# Altium schematic sheet TempMonitorSchematic.SchDoc
size A4; SheetNumber: 1; SheetTotal: 1
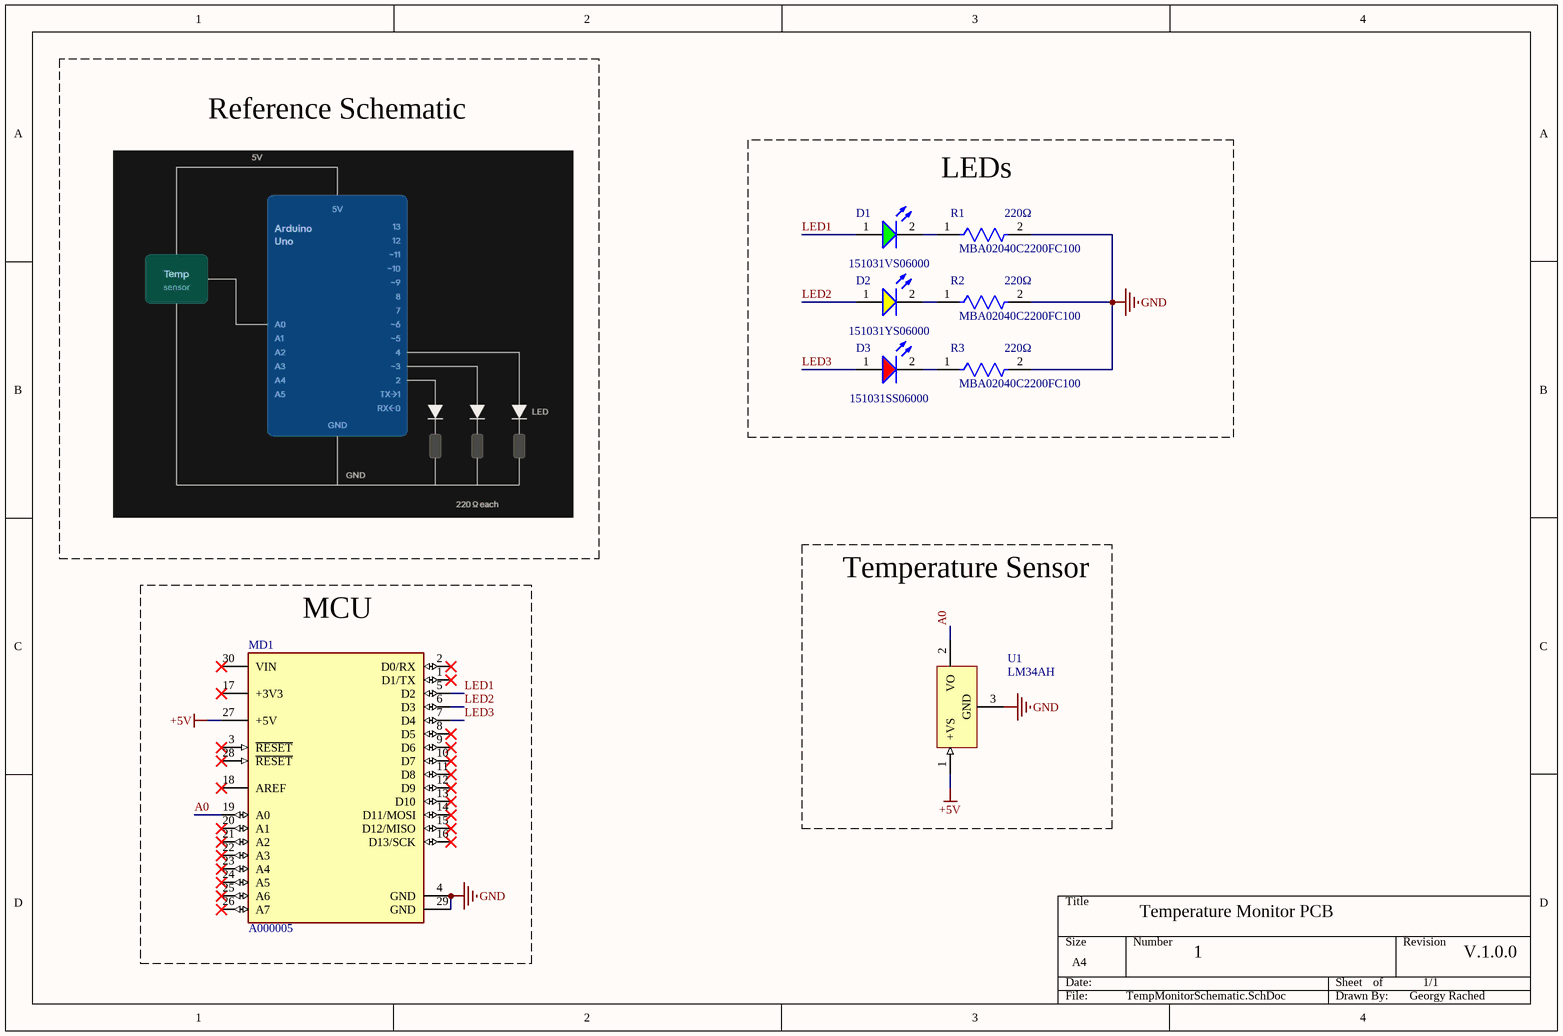
[diagram p0: TempMonitorSchematic.SchDoc]

## Parts
D1  151031VS06000  [WL-TMRC_D3.95H5.3]
D2  151031YS06000  [WL-TMRC_D3.95H5.3]
D3  151031SS06000  [WL-TMRC_D3.95H5.3]
MD1  A000005  [FP-A000005-MFG]
R1  MBA02040C2200FC100  value 220Ω  [FP-MBA0204-MFG]
R2  MBA02040C2200FC100  value 220Ω  [FP-MBA0204-MFG]
R3  MBA02040C2200FC100  value 220Ω  [FP-MBA0204-MFG]
U1  LM34AH  [NDV0003A]

## Blocks framed on the sheet
LEDs: D1-D3 R1-R3
Temperature Sensor: U1
MCU: MD1

## Nets
+5V: MD1.27(+5V) U1.1(+VS)
GND: MD1.4(GND) MD1.29(GND) R1.2 R2.2 R3.2 U1.3(GND)
A0: MD1.19(A0) U1.2(VO)
LED1: D1.1(A) MD1.5(D2)
LED2: D2.1(A) MD1.6(D3)
LED3: D3.1(A) MD1.7(D4)
NetD1_2: D1.2(K) R1.1
NetD2_2: D2.2(K) R2.1
NetD3_2: D3.2(K) R3.1

Not connected (* = marked no-connect by the designer): MD1 1(D1/TX)* 2(D0/RX)* 3(~{RESET})* 8(D5)* 9(D6)* 10(D7)* 11(D8)* 12(D9)* 13(D10)* 14(D11/MOSI)* 15(D12/MISO)* 16(D13/SCK)* 17(+3V3)* 18(AREF)* 20(A1)* 21(A2)* 22(A3)* 23(A4)* 24(A5)* 25(A6)* 26(A7)* 28(~{RESET})* 30(VIN)*

## Notes on the sheet
- Reference Schematic
- Temperature Monitor PCB
- 1
- 1/1
- V.1.0.0
- Georgy Rached

## Library data of the parts
D1 = CMP-1488-00004-3: Led, Green, T-1 (3Mm), 568 Nm, 2.2 V, 30 Ma, 20 Mcd Rohs Compliant: Yes; Manufacturer Lifecycle Status: ACTIVE; Test Current: 20mA; Wavelength: 568nm; Forward Voltage: 2.2V; Viewing Angle: 60°; Lens Style: Circular, Diffused, Round; Max Reverse Voltage (DC): 5V; YEOL: 1 = Estimated lifetime > 10 years; Forward Current: 100mA; Peak Wavelength: 560nm; Luminous Intensity: 30mcd; Case/Package: Radial; Color: Green; Lifecycle Status: Production; Height: 5.3mm; Min Operating Temperature: -40°C; Length: 3mm; RoHS: Compliant; Max Operating Temperature: 85°C; Dominant Wavelength: 568nm; Mount: Through Hole; Lead Free: Lead Free; Lens Size: 3mm; Width: 3mm; Packaging: Bulk; REACH SVHC: Unknown
D2 = CMP-1488-00006-3: Wurth Elektronik LED, WL-TMRC, 3mm (T-1), 590 nm, 3 (Dia.) x 5.3mm; Manufacturer Lifecycle Status: ACTIVE; Forward Voltage: 2V; Test Current: 20mA; Max Reverse Voltage (DC): 5V; Peak Wavelength: 592nm; Luminous Intensity: 110mcd; Viewing Angle: 60°; Forward Current: 100mA; YEOL: 1 = Estimated lifetime > 10 years; Wavelength: 590nm; Color: Yellow; Lens Style: Circular, Diffused, Round; Packaging: Bulk; Case/Package: Radial; Width: 3mm; RoHS: Compliant; Lens Size: 3mm; Max Operating Temperature: 85°C; Lifecycle Status: Production; Min Operating Temperature: -40°C; Height: 5.3mm; Length: 3mm; Dominant Wavelength: 590nm; Mount: Through Hole; REACH SVHC: Unknown
D3 = CMP-1488-00002-3: Wurth Elektronik LED, WL-TMRC, 3mm (T-1), 640 nm, 3 (Dia.) x 5.3 Lmm; Manufacturer Lifecycle Status: ACTIVE; Wavelength: 630nm; Test Current: 20mA; Luminous Intensity: 35mcd; Max Reverse Voltage (DC): 5V; Forward Current: 100mA; Viewing Angle: 60°; Color: Red; Lens Style: Circular, Diffused, Round; Dominant Wavelength: 640nm; Peak Wavelength: 650nm; YEOL: 1 = Estimated lifetime > 10 years; Forward Voltage: 2.2V; Length: 3mm; Width: 3mm; Min Operating Temperature: -40°C; Lifecycle Status: Production; RoHS: Compliant; Height: 5.3mm; Mount: Through Hole; Lens Size: 3mm; REACH SVHC: Unknown; Packaging: Bulk; Case/Package: Radial; Max Operating Temperature: 85°C
MD1 = CMP-189986-000002-1: ARDUINO NANO ATMEGA328 EVAL BRD; Number of Bits: 8; Evaluation Kit: Yes; Operating Supply Voltage: 12V; Interface: I2C; Data Bus Width: 8b; Core Architecture: AVR; Packaging: Bulk; Length: 7inch; Package Quantity: 50; Width: 5inch; REACH SVHC: No SVHC; Weight: 0.358383oz; Series: AVR® ATmega; Height: 0.25inch
R1-R3 = CMP-02408-000005-1: RES 220 OHM 0.4W 1% AXIAL; Manufacturer: Vishay BC Components; Automotive Grade: Grade 1; Voltage Rating: 200V; Temperature Coefficient: 50ppm/°C; Power Rating: 0.25W; Digikey Description: RES 220 OHM 0.4W 1% AXIAL; Height: 1.6mm; Automotive: Yes; Lead Free: Yes; Mouser Description: Thin Film Resistors - Through Hole .4watt 220ohms 1% 1/8watt body size; Temperature Range Low: -55°C; ComponentLink2Description: Datasheet; Temperature: -55°C to +125°C; Device Class L3: Through-Hole Resistors; Manufacturer Part Number: MBA02040C2200FC100; Ipc Land Pattern Name: RESAD500W65L360D160; Octopart: https://octopart.com/mba02040c2200fc100-vishay-43743094; Series: MBA/SMA 0204; RoHS: TRUE; Tolerance: 1%; Package: MBA0204; Device Class L1: Passive Components; ComponentLink2URL: http://www.vishay.com/docs/28766/mbxsma.pdf; Category: Res; Composition: Metal Film; Device Class L2: Resistors; Temperature Range High: +125°C; Resistance: 220Ω
U1 = CMP-0066-00003-3: Precision Fahrenheit Temperature Sensor, 3-pin TO-46; Manufacturer: Texas Instruments; PackageTopMarking: NSXYTTE# LM34AH; CompType: Temp Sensor IC; PowerWise: N; RoHS: N; Code_JEDEC: TO-46; ComponentLink1Description: Datasheet URL; PinCount: 3; ComponentLink1URL: http://www.ti.com/general/docs/lit/getliterature.tsp?genericPartNumber=LM34&fileType=pdf; PackageDescription: Metal Can, TO-46, 3 Lead, .100in Dia, P.C.; PackageReference: NDV0003A